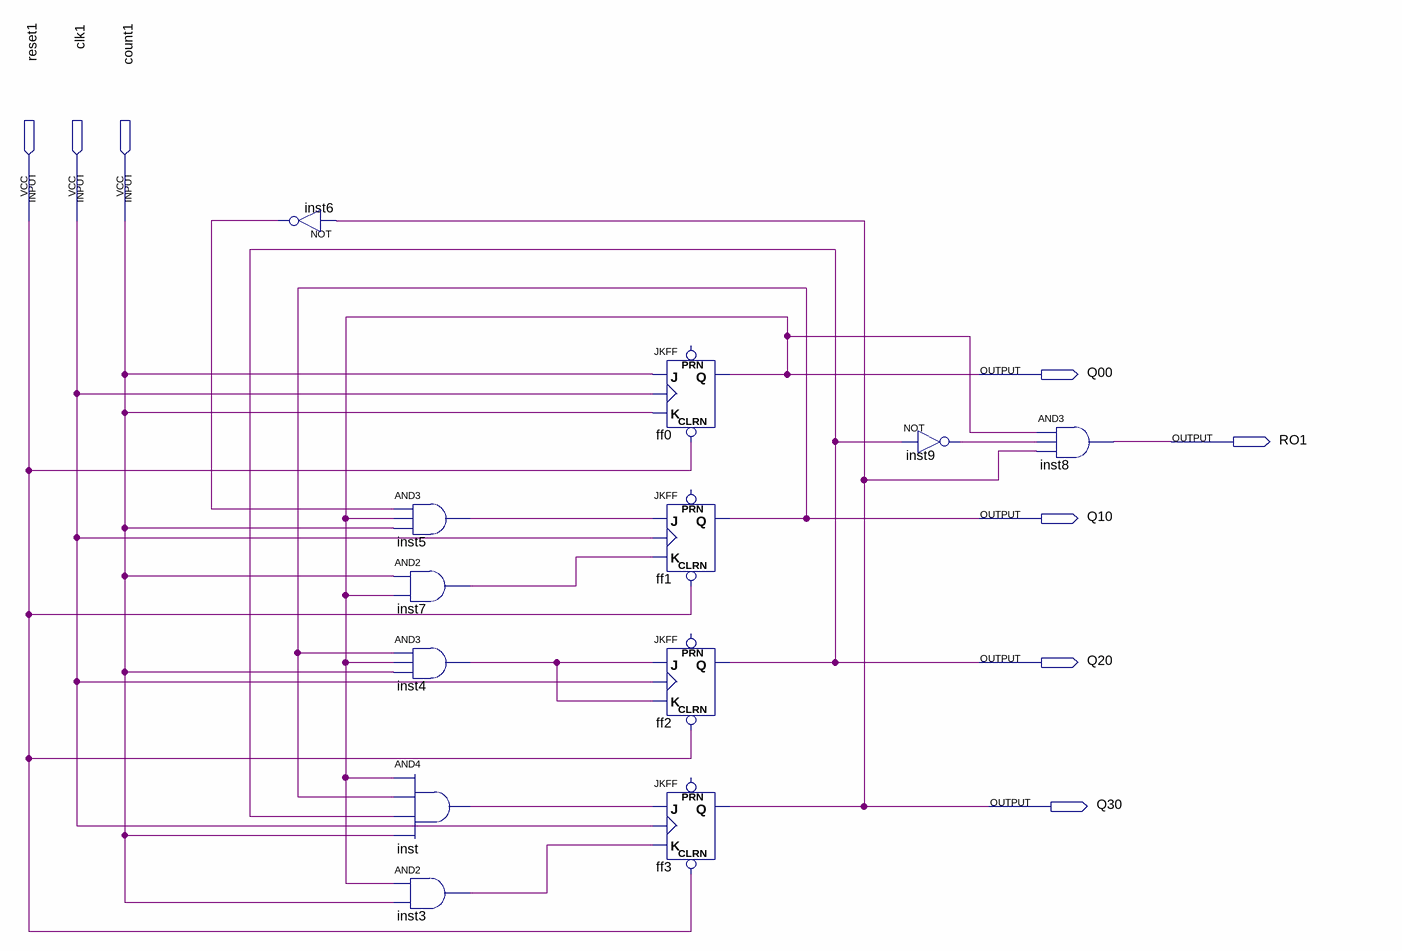
[diagram p0: schematic sheet]
// Quartus schematic FunctionalSimulationBCDCounterLab2.bdf as structural Verilog: 12 symbols, 8 pins
module FunctionalSimulationBCDCounterLab2 (
  input  reset1,
  input  clk1,
  input  count1,
  output Q00,
  output RO1,
  output Q10,
  output Q20,
  output Q30
);

  wire inst3_out, inst4_out, inst5_out, inst6_out, inst7_out, inst9_out, inst_out;

  not inst6 (inst6_out, Q30);
  and inst5 (inst5_out, inst6_out, Q00, count1);
  and inst7 (inst7_out, count1, Q00);
  and inst4 (inst4_out, Q10, Q00, count1);
  and inst (inst_out, Q00, Q10, Q20, count1);
  and inst3 (inst3_out, Q00, count1);
  JKFF ff0 (.CLRN(reset1), .K(count1), .J(count1), .CLK(clk1), .Q(Q00));  // open: PRN
  JKFF ff1 (.CLRN(reset1), .K(inst7_out), .J(inst5_out), .CLK(clk1), .Q(Q10));  // open: PRN
  JKFF ff2 (.CLRN(reset1), .K(inst4_out), .J(inst4_out), .CLK(clk1), .Q(Q20));  // open: PRN
  JKFF ff3 (.CLRN(reset1), .K(inst3_out), .J(inst_out), .CLK(clk1), .Q(Q30));  // open: PRN
  not inst9 (inst9_out, Q20);
  and inst8 (RO1, Q00, inst9_out, Q30);
endmodule
